# Altium schematic sheet Top.SchDoc
size A4; SheetNumber: 1; SheetTotal: 6
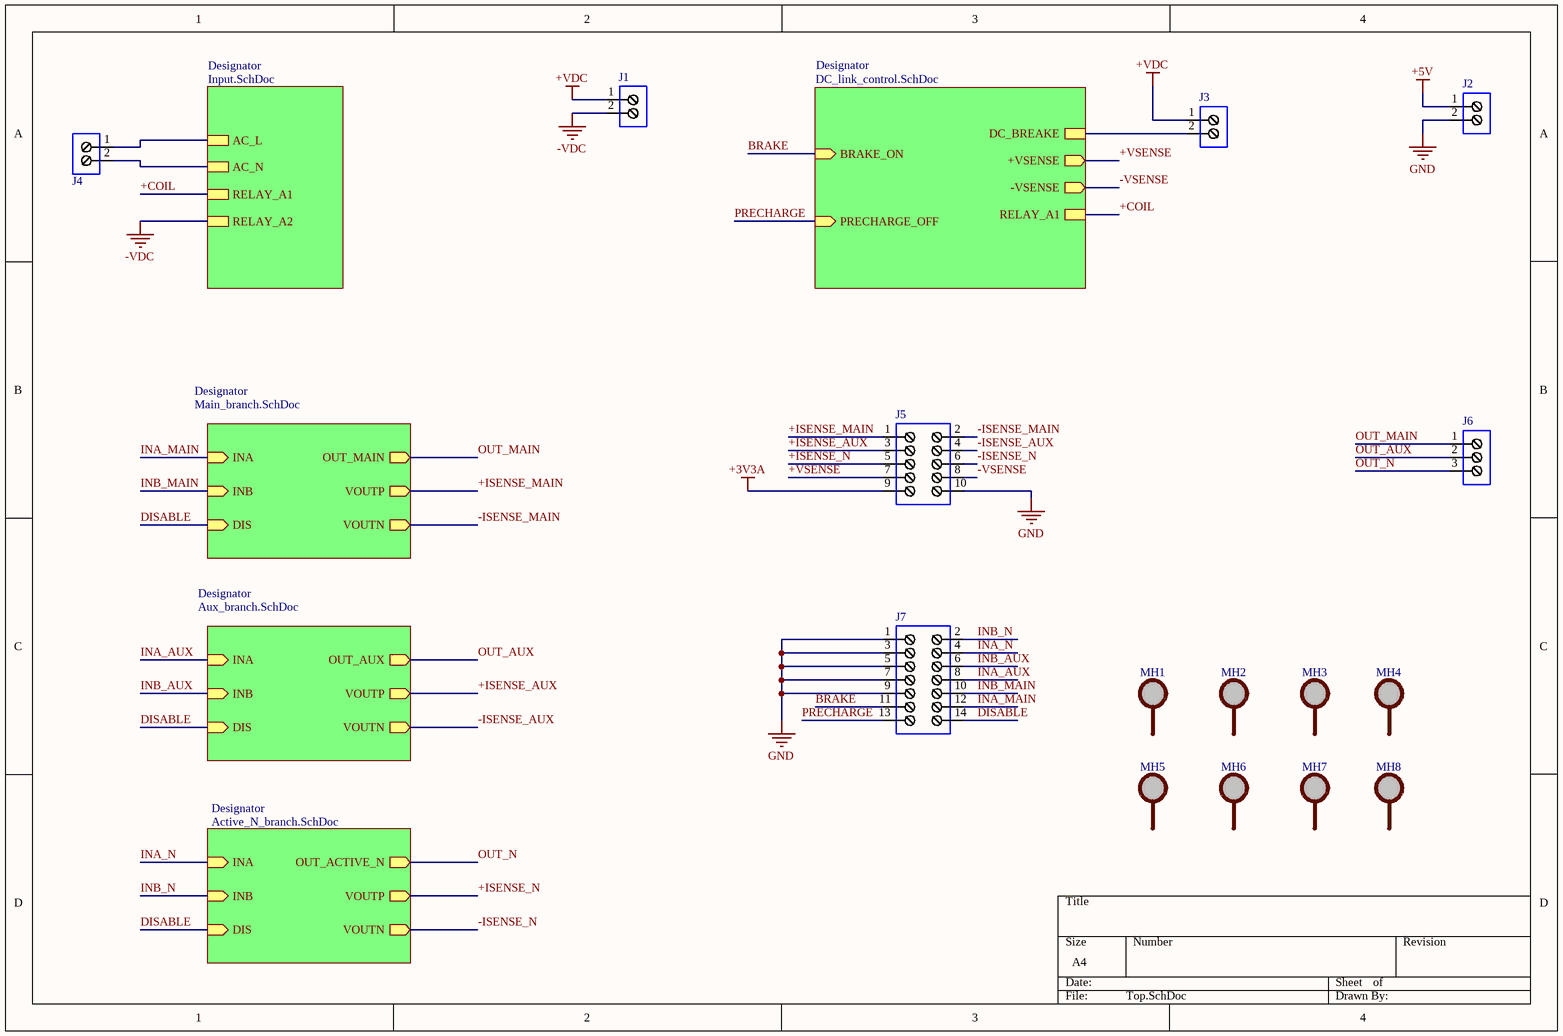
[diagram p0: Top.SchDoc]

## Parts
J1  MKDSN1.5/2  [1729018]  (value not drawn)
J2  JST_B2B-XH-A_(LF)(SN)  [JST_B2B-XH-A_(LF)(SN)]  (value not drawn)
J3  MKDSN1.5/2  [1729018]  (value not drawn)
J4  MKDSN1.5/2  [1729018]  (value not drawn)
J5  DS1013-10SSIB1-B-0  [DS1013-10SSIB1-B-0]  (value not drawn)
J6  MKDSN 1,5/ 3-5,08  [1729131]  (value not drawn)
J7  DS1013-14SSIBG  [DS1013-14SSIBG]  (value not drawn)
MH1  Mounting Hole  [M3 mounting hole]  (value not drawn)
MH2  Mounting Hole  [M3 mounting hole]  (value not drawn)
MH3  Mounting Hole  [M3 mounting hole]  (value not drawn)
MH4  Mounting Hole  [M3 mounting hole]  (value not drawn)
MH5  Mounting Hole  [M3 mounting hole]  (value not drawn)
MH6  Mounting Hole  [M3 mounting hole]  (value not drawn)
MH7  Mounting Hole  [M3 mounting hole]  (value not drawn)
MH8  Mounting Hole  [M3 mounting hole]  (value not drawn)

## Sub-sheets
Designator = Main_branch.SchDoc: OUT_MAIN (out), VOUTP (out), VOUTN (out), INB (in), INA (in), DIS (in)
Designator = DC_link_control.SchDoc: DC_BREAKE, +VSENSE (out), -VSENSE (out), BRAKE_ON (in), PRECHARGE_OFF (in), RELAY_A1
Designator = Aux_branch.SchDoc: INB (in), INA (in), DIS (in), OUT_AUX (out), VOUTP (out), VOUTN (out)
Designator = Input.SchDoc: AC_L, AC_N, RELAY_A2, RELAY_A1
Designator = Active_N_branch.SchDoc: INB (in), INA (in), DIS (in), OUT_ACTIVE_N (out), VOUTP (out), VOUTN (out)

## Nets
+3V3A: J5.9
+5V: J2.1
+VDC: J1.1 J3.1
-VDC: J1.2 ; sheet Designator/RELAY_A2
GND: J2.2 J5.10 J7.1 J7.3 J7.5 J7.7 J7.9
+COIL: sheet Designator/RELAY_A1, sheet Designator/RELAY_A1
+ISENSE_AUX: J5.3 ; sheet Designator/VOUTP
+ISENSE_MAIN: J5.1 ; sheet Designator/VOUTP
+ISENSE_N: J5.5 ; sheet Designator/VOUTP
+VSENSE: J5.7 ; sheet Designator/+VSENSE
-ISENSE_AUX: J5.4 ; sheet Designator/VOUTN
-ISENSE_MAIN: J5.2 ; sheet Designator/VOUTN
-ISENSE_N: J5.6 ; sheet Designator/VOUTN
-VSENSE: J5.8 ; sheet Designator/-VSENSE
BRAKE: J7.11 ; sheet Designator/BRAKE_ON
DISABLE: J7.14 ; sheet Designator/DIS, sheet Designator/DIS, sheet Designator/DIS
INA_AUX: J7.8 ; sheet Designator/INA
INA_MAIN: J7.12 ; sheet Designator/INA
INA_N: J7.4 ; sheet Designator/INA
INB_AUX: J7.6 ; sheet Designator/INB
INB_MAIN: J7.10 ; sheet Designator/INB
INB_N: J7.2 ; sheet Designator/INB
OUT_AUX: J6.2 ; sheet Designator/OUT_AUX
OUT_MAIN: J6.1 ; sheet Designator/OUT_MAIN
OUT_N: J6.3 ; sheet Designator/OUT_ACTIVE_N
PRECHARGE: J7.13 ; sheet Designator/PRECHARGE_OFF
NetJ3_2: J3.2 ; sheet Designator/DC_BREAKE
NetJ4_1: J4.1 ; sheet Designator/AC_L
NetJ4_2: J4.2 ; sheet Designator/AC_N

## Library data of the parts
J1 J3 J4 = 1729018: Connector: PCB terminal block; 17.5A; 400V; PIN: 2; screw terminal
J2 = JST_B2B-XH-A_(LF)(SN): Connector: wire-board; XH; socket; male; data; 3A; 250V; PIN: 2; 2.5mm
J5 = DS1013-10SSIB1-B-0: Connector: IDC; socket; male; PIN: 10; straight; THT; 2.54mm; 2x5
J6 = 1729131: Connector: PCB terminal block; 17.5A; 400V; PIN: 3; screw terminal
J7 = DS1013-14SSIBG: Connector: IDC; socket; male; data; PIN: 14; straight; THT; 2.54mm
MH1-MH8 = M3_mounting_hole